# EasyEDA Pro project LinTOS_2026-10-19.epro, schematic Schematic1
Assembly Variant: Basic; Board Name: Board1; Create Date: 2026-08-16; Page Name: P1; Project Name: ESP32-S3-RLCD-BBK; Schematic Name: Schematic1; Update Date: 2026-08-16; Company: 嘉立创EDA; Page Size: A4; Version: V1.0
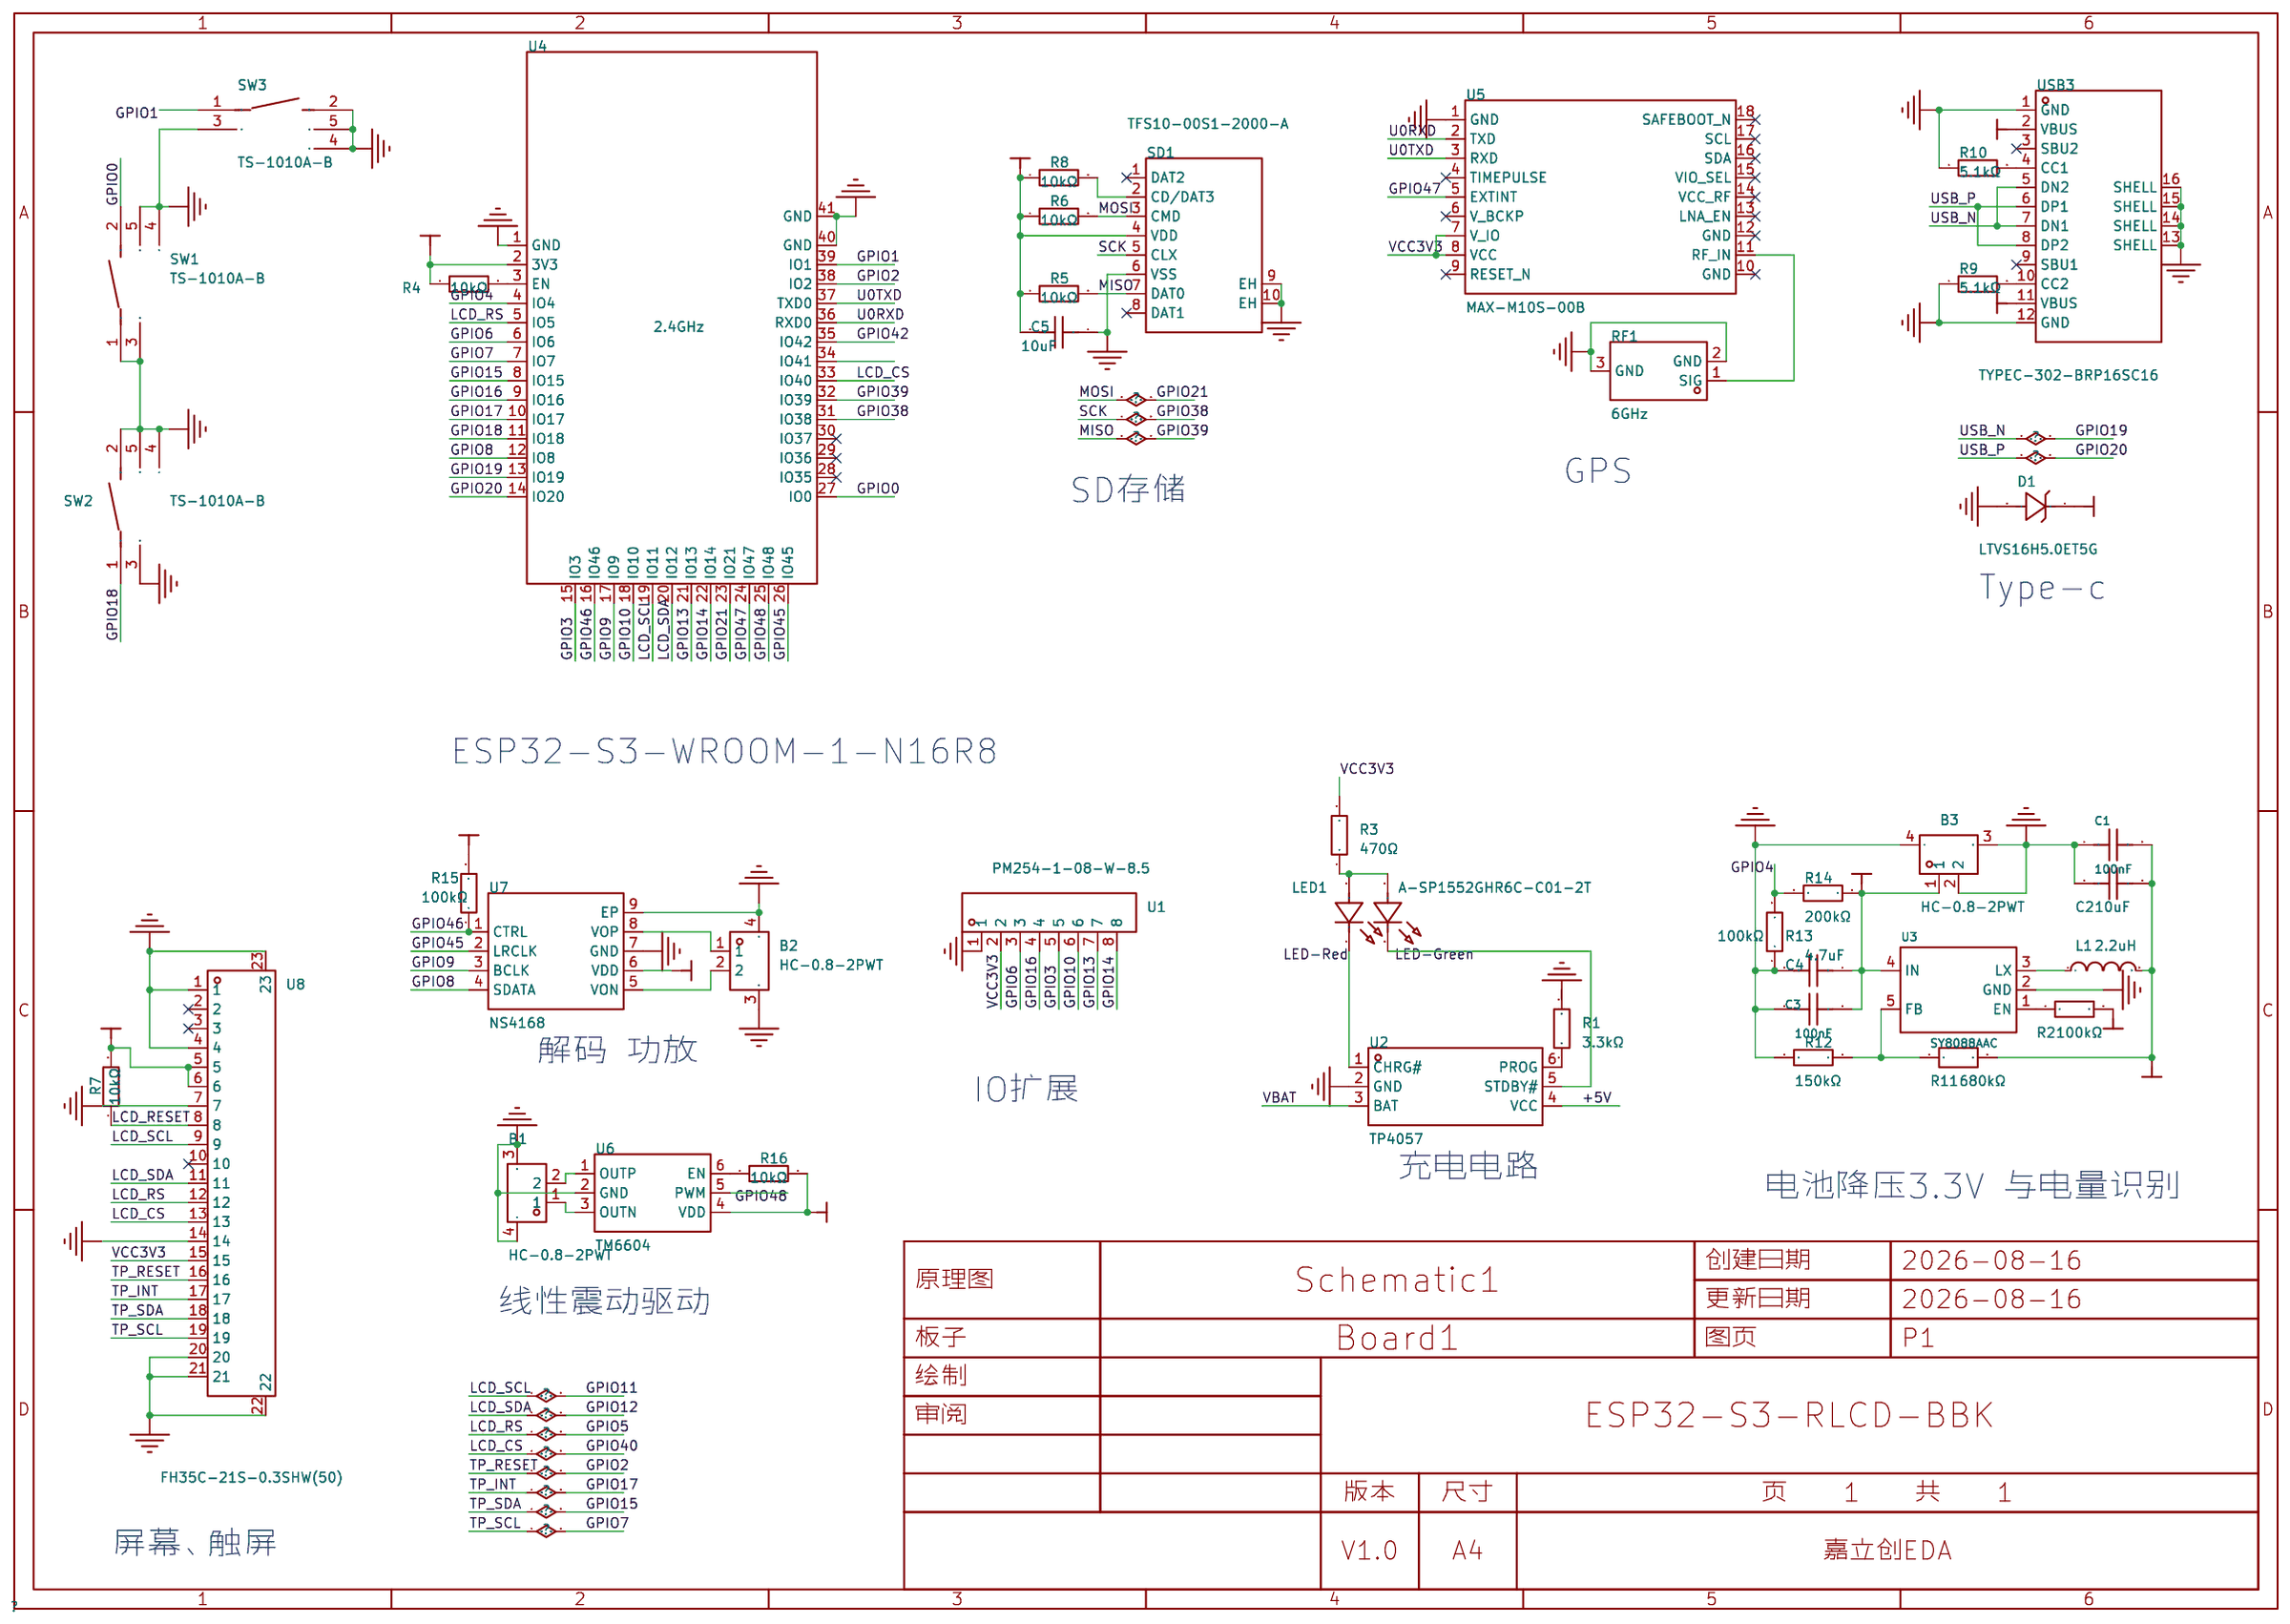
[diagram p0: schematic sheet]

## Parts
B1  HC-0.8-2PWT  [CONN-SMD_2P-P0.80_HCTL_HC-0.8-2PWT]
B2  HC-0.8-2PWT  [CONN-SMD_2P-P0.80_HCTL_HC-0.8-2PWT]
B3  HC-0.8-2PWT  [CONN-SMD_2P-P0.80_HCTL_HC-0.8-2PWT]
C1  100nF  [C0603]
C2  10uF  [C0603]
C3  100nF  [C0603]
C4  4.7uF  [C0603]
C5  10uF  [C0603]
D1  LTVS16H5.0ET5G  [DFN1610-2L_L1.6-W1.0-P1.10-RD]
L1  2.2uH  [IND-SMD_L3.0-W3.0_CDRH2D18-HPNP]
LED1  A-SP1552GHR6C-C01-2T  [LED-SMD_4P-L3.2-W1.6-TR_A-SP1552GHR6C]
R1  3.3kΩ  [R0603]
R2  100kΩ  [R0603]
R3  470Ω  [R0603]
R4  10kΩ  [R0603]
R5  10kΩ  [R0603]
R6  10kΩ  [R0603]
R7  10kΩ  [R0603]
R8  10kΩ  [R0603]
R9  5.1kΩ  [R0603]
R10  5.1kΩ  [R0603]
R11  680kΩ  [R0603]
R12  150kΩ  [R0603]
R13  100kΩ  [R0603]
R14  200kΩ  [R0603]
R15  100kΩ  [R0603]
R16  10kΩ  [R0603]
RF1  6GHz  [IPEX-SMD_BWIPX-1-001E]
SD1  TFS10-00S1-2000-A  [SIM-SMD_TFS10-00S1-2000-A]
SW1  TS-1010A-B  [SW-SMD_TS-1010A-B]
SW2  TS-1010A-B  [SW-SMD_TS-1010A-B]
SW3  TS-1010A-B  [SW-SMD_TS-1010A-B]
U1  PM254-1-08-W-8.5  [HDR-TH_8P-P2.54-H-F-W10.0-N]
U2  TP4057  [SOT-23-6_L2.9-W1.6-P0.95-LS2.8-BR]
U3  SY8088AAC  [SOT-23-5_L3.0-W1.7-P0.95-LS2.8-BR]
U4  2.4GHz  [WIRELM-SMD_ESP32-S3-WROOM-1]
U5  MAX-M10S-00B  [SMD-18_L10.1-W9.7-P1.10-TL_SKG09F]
U6  TM6604  [SOT-23-6_L2.9-W1.6-P0.95-LS2.8-BR]
U7  NS4168  [ESOP-8_L4.9-W3.9-P1.27-LS6.0-BL-EP]
U8  FH35C-21S-0.3SHW(50)  [FPC-SMD_21P-P0.30_FH35C-21S-0.3SHW-50]
USB3  TYPEC-302-BRP16SC16  [USB-C-SMD_TYPEC-302-BRP16SC16]

## Library data of the parts
B1-B3 = HC-0.8-2PWT: 插针结构:1x2P;间距:0.8mm;安装方式:卧贴;参考系列:-;总PIN数:2P;排数:1;每排PIN数:2;行距:-;额定电流:500mA;触头材质:磷青铜;触头镀层:锡;工作温度范围:-25℃~+85℃;; LCSC Part Name: 1x2P 间距:0.8mm 卧贴; Supplier Part: C2845343; Manufacturer: HCTL(华灿天禄); Supplier Footprint: SMD,P=0.8mm,卧贴; JLCPCB Part Class: Extended Part; Datasheet: https://atta.szlcsc.com/upload/public/pdf/source/20230707/4723FD87455A1B942ECF59815D4E1AAF.pdf; Supplier: LCSC; Pins Structure: 1x2P; Pitch: 0.8mm; Mounting Style: 卧贴; Number of Pins: 2P; Number of Rows: 1; Number of PINs Per Row: 2; Current Rating (Max): 500mA; Contact Material: 磷青铜; Contact Plating: 锡; Operating Temperature Range: -25℃~+85℃; Rated Voltage (Max): 30V; Plastic Material: LCP; Flame Retardant Rating: UL94V-0; Supplementary Features: 辅助焊脚; Z-Height of the Board: 1.85mm; X-Length of Bottom Edge on Board (Spacing Line): 3.8mm; Y-Width of Bottom Edge on Board: 2.8mm; Check: true
C1 C3 = CC0603KRX7R9BB104: 容值:100nF;精度:±10%;额定电压:50V;温度系数:X7R;; LCSC Part Name: 100nF ±10% 50V; Supplier Part: C14663; Manufacturer: YAGEO(国巨); Supplier Footprint: 0603; JLCPCB Part Class: Basic Part; Datasheet: https://item.szlcsc.com/datasheet/CC0603KRX7R9BB104/15331.html; Supplier: LCSC; Tolerance: ±10%; Voltage Rating: 50V; Temperature Coefficient: X7R
C2 C5 = CL10A106KP8NNNC: 容值:10uF;精度:±10%;额定电压:10V;温度系数:X5R;; LCSC Part Name: 10uF ±10% 10V; Supplier Part: C19702; Manufacturer: SAMSUNG(三星); Supplier Footprint: 0603; JLCPCB Part Class: Basic Part; Datasheet: https://item.szlcsc.com/datasheet/CL10A106KP8NNNC/20411.html; Supplier: LCSC; Tolerance: ±10%; Voltage Rating: 10V; Temperature Coefficient: X5R
C4 = CL10A475KO8NNNC: 容值:4.7uF;精度:±10%;额定电压:16V;温度系数:X5R;; LCSC Part Name: 4.7uF ±10% 16V; Supplier Part: C19666; Manufacturer: SAMSUNG(三星); Supplier Footprint: 0603; JLCPCB Part Class: Basic Part; Datasheet: https://item.szlcsc.com/datasheet/CL10A475KO8NNNC/20375.html; Supplier: LCSC; Tolerance: ±10%; Voltage Rating: 16V; Temperature Coefficient: X5R; Check: true
D1 = LTVS16H5.0ET5G: 极性:单向;反向截止电压(Vrwm):5V;钳位电压:10.8V;峰值脉冲电流(Ipp):150A@8/20us;峰值脉冲功率(Ppp):1.8kW@8/20us;击穿电压:7.1V;; LCSC Part Name: 单向 5V截止 峰值浪涌电流：150A@8/20us; Supplier Part: C383280; Manufacturer: LRC(乐山无线电); Supplier Footprint: DFN1610-2; JLCPCB Part Class: Extended Part; Datasheet: https://item.szlcsc.com/datasheet/LTVS16H5.0ET5G/356587.html; Supplier: LCSC; Polarity: 单向; Reverse Stand-Off Voltage (Vrwm): 5V; Clamping Voltage: 10.8V; Peak Pulse Current (Ipp): 150A@8/20us; Peak Pulse Power Dissipation (Ppp): 1.8kW@8/20us; Voltage - Breakdown: 7.1V; Reverse Leakage Current (Ir): 600nA; level of protection: IEC 61000-4-2; Junction Capacitance: 800pF; Check: true
L1 = CDRH2D14NP-2R2NC: 电感值:2.2uH;精度:±30%;额定电流:-;饱和电流(Isat):1.5A;; LCSC Part Name: 2.2uH ±30% 1.5A; Supplier Part: C167267; Manufacturer: Sumida(胜美达); Supplier Footprint: SMD,3x3x1.4mm; JLCPCB Part Class: Extended Part; Datasheet: https://atta.szlcsc.com/upload/public/pdf/source/20180125/C167267_15168650612721302968.pdf; Supplier: LCSC; Tolerance: ±30%; Saturation Current (Isat): 1.5A; DC Resistance (DCR): 94mΩ; Check: true
LED1 = A-SP1552GHR6C-C01-2T: 灯头类型:-;发光颜色:绿色,红色;正向压降(Vf):1.6V~2.2V；2.3V~3V;功率:60mW；90mW;正向电流:5mA;波长:520nm~535nm；617.5nm~625.5nm;二极管配置:独立二极管;透镜颜色:无色透明透镜;色温:-;发光强度:180mcd；450mcd;发光角度:120°;载带方式:正贴;工作温度:-40℃~+85℃;; LCSC Part Name: 3227绿红双色正贴; Supplier Part: C19171239; Manufacturer: Amicc(欧密格光电); Supplier Footprint: SMD-4P,3.2x2.7mm; JLCPCB Part Class: Extended Part; Datasheet: https://item.szlcsc.com/datasheet/A-SP1552GHR6C-C01-2T/20382146.html; Supplier: LCSC; Illumination Color: 绿色,红色; Voltage - Forward(Vf): 1.6V~2.2V；2.3V~3V; Power(Watts): 60mW；90mW; Forward Current: 5mA; Wavelength - Dominant: 520nm~535nm；617.5nm~625.5nm; Peak Wavelength: 518nm；632nm; Diode Configuration: 独立二极管; Lens Color: 无色透明透镜; Luminous Intensity: 180mcd；450mcd; Viewing Angle: 120°; Mounting Style: 正贴; Operating Temperature: -40℃~+85℃; Check: true
R1 = 0603WAF3301T5E: 电阻类型:厚膜电阻;阻值:3.3kΩ;精度:±1%;功率:100mW;工作电压:75V;温度系数:±100ppm/℃;; LCSC Part Name: 3.3kΩ ±1% 100mW 厚膜电阻; Supplier Part: C22978; Manufacturer: UNI-ROYAL(厚声); Supplier Footprint: 0603; JLCPCB Part Class: Basic Part; Datasheet: https://item.szlcsc.com/datasheet/0603WAF3301T5E/23705.html; Supplier: LCSC; Type: 厚膜电阻; Tolerance: ±1%; Power(Watts): 100mW; Voltage-Supply(Max): 75V; Temperature Coefficient: ±100ppm/℃; Operating Temperature: -55℃~+155℃
R2 R13 R15 = 0603WAF1003T5E: 电阻类型:厚膜电阻;阻值:100kΩ;精度:±1%;功率:100mW;工作电压:75V;温度系数:±100ppm/℃;; LCSC Part Name: 100kΩ ±1% 100mW 厚膜电阻; Supplier Part: C25803; Manufacturer: UNI-ROYAL(厚声); Supplier Footprint: 0603; JLCPCB Part Class: Basic Part; Datasheet: https://item.szlcsc.com/datasheet/0603WAF1003T5E/26546.html; Supplier: LCSC; Type: 厚膜电阻; Tolerance: ±1%; Power(Watts): 100mW; Voltage-Supply(Max): 75V; Temperature Coefficient: ±100ppm/℃; Operating Temperature: -55℃~+155℃; Check: true
R3 = 0603WAF4700T5E: 电阻类型:厚膜电阻;阻值:470Ω;精度:±1%;功率:100mW;工作电压:75V;温度系数:±100ppm/℃;; LCSC Part Name: 470Ω ±1% 100mW 厚膜电阻; Supplier Part: C23179; Manufacturer: UNI-ROYAL(厚声); Supplier Footprint: 0603; JLCPCB Part Class: Basic Part; Datasheet: https://item.szlcsc.com/datasheet/0603WAF4700T5E/23906.html; Supplier: LCSC; Type: 厚膜电阻; Tolerance: ±1%; Power(Watts): 100mW; Voltage-Supply(Max): 75V; Temperature Coefficient: ±100ppm/℃; Operating Temperature: -55℃~+155℃
R4 = 0603WAF1002T5E: 电阻类型:厚膜电阻;阻值:10kΩ;精度:±1%;功率:100mW;工作电压:75V;温度系数:±100ppm/℃;; LCSC Part Name: 厚膜电阻 10kΩ ±1% 100mW; Supplier Part: C25804; Manufacturer: UNI-ROYAL(厚声); Supplier Footprint: 0603; JLCPCB Part Class: Basic Part; Datasheet: https://item.szlcsc.com/datasheet/0603WAF1002T5E/26547.html; Supplier: LCSC; Type: 厚膜电阻; Tolerance: ±1%; Power(Watts): 100mW; Voltage-Supply(Max): 75V; Temperature Coefficient: ±100ppm/℃; Operating Temperature: -55℃~+155℃; Check: true
R5-R8 R16 = 0603WAF1002T5E: 电阻类型:厚膜电阻;阻值:10kΩ;精度:±1%;功率:100mW;工作电压:75V;温度系数:±100ppm/℃;; LCSC Part Name: 厚膜电阻 10kΩ ±1% 100mW; Supplier Part: C25804; Manufacturer: UNI-ROYAL(厚声); Supplier Footprint: 0603; JLCPCB Part Class: Basic Part; Datasheet: https://item.szlcsc.com/datasheet/0603WAF1002T5E/26547.html; Supplier: LCSC; Type: 厚膜电阻; Tolerance: ±1%; Power(Watts): 100mW; Voltage-Supply(Max): 75V; Temperature Coefficient: ±100ppm/℃; Operating Temperature: -55℃~+155℃
R9 R10 = 0603WAF5101T5E: 电阻类型:厚膜电阻;阻值:5.1kΩ;精度:±1%;功率:100mW;工作电压:75V;温度系数:±100ppm/℃;; LCSC Part Name: 5.1kΩ ±1% 100mW 厚膜电阻; Supplier Part: C23186; Manufacturer: UNI-ROYAL(厚声); Supplier Footprint: 0603; JLCPCB Part Class: Basic Part; Datasheet: https://item.szlcsc.com/datasheet/0603WAF5101T5E/23913.html; Supplier: LCSC; Type: 厚膜电阻; Tolerance: ±1%; Power(Watts): 100mW; Voltage-Supply(Max): 75V; Temperature Coefficient: ±100ppm/℃; Operating Temperature: -55℃~+155℃; Check: true
R11 = FRC0603F6803TS: 电阻类型:厚膜电阻;阻值:680kΩ;精度:±1%;功率:100mW;工作电压:75V;温度系数:±100ppm/℃;; LCSC Part Name: 680kΩ ±1% 100mW 厚膜电阻; Supplier Part: C2907061; Manufacturer: FOJAN(富捷); Supplier Footprint: 0603; JLCPCB Part Class: Extended Part; Supplier: LCSC; Type: 厚膜电阻; Tolerance: ±1%; Power(Watts): 100mW; Voltage-Supply(Max): 75V; Temperature Coefficient: ±100ppm/℃; Operating Temperature: -55℃~+155℃
R12 = 0603WAF1503T5E: 电阻类型:厚膜电阻;阻值:150kΩ;精度:±1%;功率:100mW;工作电压:75V;温度系数:±100ppm/℃;; LCSC Part Name: 150kΩ ±1% 100mW 厚膜电阻; Supplier Part: C22807; Manufacturer: UNI-ROYAL(厚声); Supplier Footprint: 0603; JLCPCB Part Class: Basic Part; Datasheet: https://item.szlcsc.com/datasheet/0603WAF1503T5E/23534.html; Supplier: LCSC; Type: 厚膜电阻; Tolerance: ±1%; Power(Watts): 100mW; Voltage-Supply(Max): 75V; Temperature Coefficient: ±100ppm/℃; Operating Temperature: -55℃~+155℃
R14 = 0603WAF2003T5E: 电阻类型:厚膜电阻;阻值:200kΩ;精度:±1%;功率:100mW;最大工作电压:75V;温度系数:±100ppm/℃;; LCSC Part Name: 200kΩ ±1% 100mW 厚膜电阻; Supplier Part: C25811; Manufacturer: UNI-ROYAL(厚声); Supplier Footprint: 0603; JLCPCB Part Class: Basic Part; Datasheet: https://atta.szlcsc.com/upload/public/pdf/source/20200306/C422600_1E6D84923E4A46A82E41ADD87F860B5C.pdf; Supplier: LCSC; Type: 厚膜电阻; Tolerance: ±1%; Power(Watts): 100mW; Overload Voltage (Max): 75V; Temperature Coefficient: ±100ppm/℃; Operating Temperature Range: -55℃~+155℃; Check: true
RF1 = BWIPX-1-001E: 连接器类型:板端;接口类型:内针;端口数量:1;接口直径:2mm;接口长度/高度:1.25mm;频率:6GHz;射频系列:IPEX;阻抗:50Ω;样式:-;工作温度:-40℃~+85℃;; LCSC Part Name: 内针 IPEX; Supplier Part: C496552; Manufacturer: BAT WIRELESS(蝙蝠无线); Supplier Footprint: SMD; JLCPCB Part Class: Extended Part; Datasheet: https://item.szlcsc.com/datasheet/BWIPX-1-001E/508501.html; Supplier: LCSC; Connector Type: 板端; Interface: 内针; Number of Ports: 1; Interface Diameter: 2mm; Interface Length/Height: 1.25mm; RF Series: IPEX; Impedance: 50Ω; Operating Temperature Range: -40℃~+85℃
SD1 = TFS10-00S1-2000-A: 卡连接方式:拔插式;卡类型:MicroSD卡(TF卡);连接器类型:卡座;本体最大高度:1.9mm;工作温度:-25℃~+90℃;; LCSC Part Name: 拔插式 MicroSD卡(TF卡) 卡座; Supplier Part: C22357902; Manufacturer: XFCN(兴飞); Supplier Footprint: SMD; JLCPCB Part Class: Extended Part; Datasheet: https://item.szlcsc.com/datasheet/TFS10-00S1-2000-A/23793223.html; Supplier: LCSC; Card Connection Mode: 拔插式; Card Type: MicroSD卡(TF卡); Connector Type: 卡座; Additional Card Detection Pins: 无; Height Above Board: 1.9mm; Operating Temperature: -25℃~+90℃
SW1-SW3 = TS-1010A-B: 电路结构:单刀单掷;按钮形状:矩形按钮;作用力:1.6N;安装方式:卧贴;开关长度:4.5mm;开关宽度:3.5mm;开关高度:1.7mm;带支架:不带支架;触点电流:50mA;额定电压:12V;带灯:无;工作寿命:10万次;; LCSC Part Name: 4.5*3.5*1.7mm 卧贴 轻触开关; Supplier Part: C381059; Manufacturer: XKB Connection(中国星坤); Supplier Footprint: SMD,4.5x3.5mm; JLCPCB Part Class: Extended Part; Datasheet: https://item.szlcsc.com/datasheet/TS-1010A-B/353291.html; Supplier: LCSC; Circuit: 单刀单掷; Actuator Style: 矩形按钮; Operating Force: 1.6N; Mounting Type: 卧贴; Length: 4.5mm; Width: 3.5mm; Switch Height: 1.7mm; with Bracket: 不带支架; Contact Current: 50mA; Voltage Rating: 12V; Actuator/Cap Color: 黑色; With Lamp: 无; Life: 10万次; Operating Temperature: -30℃~+85℃
U1 = PM254-1-08-W-8.5: 插孔结构:1x8P;间距:2.54mm;行距:-;圆孔/方孔:方孔;安装方式:弯插;排数:单排;总孔位数:8P;额定电流:3A;额定电压:-;插孔方向:侧面;塑高:8.5mm;触头材质:铜合金;工作温度:-40℃~+105℃;; LCSC Part Name: 1x8P 间距:2.54mm 弯插; Supplier Part: C2897390; Manufacturer: HCTL(华灿天禄); Supplier Footprint: 弯插,P=2.54mm; JLCPCB Part Class: Extended Part; Datasheet: https://item.szlcsc.com/datasheet/PM254-1-08-W-8.5/3142395.html; Supplier: LCSC; Holes Structure: 1x8P; Pitch: 2.54mm; Circular Hole / Square Hole: 方孔; Mounting Type: 弯插; Number of Rows: 单排; Number of Positions: 8P; Current Rating: 3A; Holes Direction: 侧面; Insulation Height: 8.5mm; Contact Material: 铜合金; Operating Temperature: -40℃~+105℃
U2 = TP4057: 工作电压:4V~6.5V;最大充电电流:500mA;电池类型:锂电池;电池节数:1;; LCSC Part Name: 500mA线性锂离子电池充电器; Supplier Part: C725791; Manufacturer: UMW(友台半导体); Supplier Footprint: SOT-23-6; JLCPCB Part Class: Extended Part; Datasheet: https://item.szlcsc.com/datasheet/TP4057/772194.html; Supplier: LCSC; The Chip Type: 充电芯片; Voltage - Supply: 4V~6.5V; Charge Current - Max: 500mA; Charging Saturation Voltage: 4.24V; Type of Battery: 锂电池; Number of Cells: 1; Operating Temperature: -40℃~+85℃; Battery Temperature Detection: 支持; Supply Current (Iq): 25uA; Features: 恒压充电；恒流充电；自动再充电；充电终止；软启动；可编程充电电流；欠压锁定；涓流充电; Check: true
U3 = SY8088AAC: 功能类型:降压型;工作电压:2.5V~5.5V;输出电压:-;输出电流:1A;输出类型:可调;; LCSC Part Name: 降压型 1A 2.5V~5.5V; Supplier Part: C79313; Manufacturer: Silergy(矽力杰); Supplier Footprint: SOT-23-5; JLCPCB Part Class: Extended Part; Datasheet: https://item.szlcsc.com/datasheet/SY8088AAC/80451.html; Supplier: LCSC; Function: 降压型; Voltage - Supply: 2.5V~5.5V; Output Current: 1A; Frequency - Switching: 1.5MHz; Operating Temperature: -40℃~+85℃@(TA)；-40℃~+125℃@(TJ); Synchronous Rectifier: 是; Number of Outputs: 1; Topology: 降压式; Quiescent Current: 40uA; Switch tube (built-in/external): 内置; Output Type: 可调; Features: 轻载高效模式；打嗝限流; Check: true
U4 = ESP32-S3-WROOM-1-N16R8: 核心芯片:ESP32-S3R8;频率:2.4GHz;天线形式:板载PCB天线;发射功率:20.5dBm;接收灵敏度:-103.5dBm;; LCSC Part Name: 不带固件 通用型Wi-Fi+低功耗蓝牙MCU模组; Supplier Part: C2913202; Manufacturer: ESPRESSIF(乐鑫); Supplier Footprint: SMD,25.5x18mm; JLCPCB Part Class: Extended Part; Datasheet: https://item.szlcsc.com/datasheet/ESP32-S3-WROOM-1-N16R8/3198300.html; Supplier: LCSC; Utilized IC / Part: ESP32-S3R8; Interface Type: I2C；GPIO；UART；SPI；USB；I2S; Antenna Type: 板载PCB天线; Output Power: 20.5dBm; Voltage - Supply: 3V~3.6V; Receive  Current: 95mA; Send  Current: 355mA; Sensitivity: -103.5dBm; Operating Temperature: -40℃~+65℃; Check: true
U5 = MAX-M10S-00B: 该模块采用u-blox M10标准精度GNSS平台，为所有L1 GNSS信号提供出色的灵敏度和捕获时间。支持同时接收四个GNSS（GPS、GLONASS、伽利略和北斗）。大量可见卫星使接收器能够选择最佳信号，这最大限度地提高了位置可用性，特别是在诸如深城市峡谷等具有挑战性的条件下。u-blox Super-S（超信号）技术提供了出色的射频灵敏度，并且可以在使用小天线或非视距场景中提高动态定位精度; LCSC Part Name: 标准精度GNSS模块; Supplier Part: C4153167; Manufacturer: U-BLOX(优北罗); Supplier Footprint: LCC-18(9.7x10.1); JLCPCB Part Class: Extended Part; Datasheet: https://item.szlcsc.com/datasheet/MAX-M10S-00B/4722633.html; Supplier: LCSC; Features: 热启动加速；短路检测
U6 = TM6604_C22362584: 灵活触控反馈/Vibra驱动程序1.8V兼容，5V容限数字引脚; LCSC Part Name: 线性振动马达驱动 停产; Supplier Part: C22362584; Manufacturer: TM(天微); Supplier Footprint: SOT-23-6; JLCPCB Part Class: Extended Part; Datasheet: https://item.szlcsc.com/datasheet/TM6604/23808696.html; Supplier: LCSC; Voltage - Supply: 2.7V~5.2V; Quiescent Current(Iq): 1.7mA; Operating Temperature: -40℃~+85℃; Features: 软开关；主动制动功能；电流采样/调节功能
U7 = NS4168_C910588: 功放类型:D类功放;扬声器通道数:单声道;输出功率:2.5Wx1@4Ω;静态电流(Iq):13mA;; LCSC Part Name: 2.5W-I2S数字输入单声道D类音频功率放大器; Supplier Part: C910588; Manufacturer: Nsiway(纳芯威); Supplier Footprint: ESOP-8-EP(3.9x4.9x1.27); JLCPCB Part Class: Extended Part; Datasheet: https://item.szlcsc.com/datasheet/NS4168/978904.html; Supplier: LCSC; Class: D类功放; Speaker Channels: 单声道; Output Power: 2.5Wx1@4Ω; Total Harmonic Distortion + Noise (THD+N): 0.2%; Quiescent Current: 13mA; Signal-to-Noise Ratio: 85dB; Power Supply Rejection Ratio (PSRR): -80dB; Efficiency: 80%; Features: 无滤波器架构；使能/关断功能；自动静音/免噪音开关；内置音频处理；可配置输出拓扑; Voltage - Supply: 3V~5.5V; Check: true
U8 = FH35C-21S-0.3SHW(50): 锁定特性:翻盖式;触点类型:双侧触点/上下接;触点数量:21P;间距:0.3mm;安装方式:卧贴;工作温度:-55℃~+85℃;; LCSC Part Name: 间距:0.3mm P数:21P 翻盖式 双侧触点/上下接; Supplier Part: C5242964; Manufacturer: HRS(广濑); Supplier Footprint: SMD,P=0.3mm,卧贴; JLCPCB Part Class: Extended Part; Datasheet: https://item.szlcsc.com/datasheet/FH35C-21S-0.3SHW(50)/5951809.html; Supplier: LCSC; Locking Feature: 翻盖式; Contact Type: 双侧触点/上下接; Number of Contacts: 21P; Pitch: 0.3mm; Mounting Type: 卧贴; FFC, FCB Thickness: 0.2mm; Height Above Board: 0.88mm; Contact Material: 磷青铜; Contact Plating: 金; Operating Temperature: -55℃~+85℃; Check: true
USB3 = TYPEC-302-BRP16SC16: 连接器类型:Type-C;协议标准:USB 3.1;公母:母;安装方式:沉板;触点数量:16P;端口数量:1;额定电流 - 电源:5A;工作温度:-45℃~+85℃;; LCSC Part Name: Type-C 母 沉板; Supplier Part: C2835313; Manufacturer: XUNPU(讯普); Supplier Footprint: SMD; JLCPCB Part Class: Extended Part; Datasheet: https://item.szlcsc.com/datasheet/TYPEC-302-BRP16SC16/2998971.html; Supplier: LCSC; Connector Type: Type-C; Protocol Standard: USB 3.1; Gender: 母; Mounting Type: 沉板; Number of Contacts: 16P; Number of Ports: 1; Current Rating-Power: 5A; Voltage Rating: 5V; Connect-Disconnect Life: 1万次; Length: 6.5mm; Detection color: 黑色; Operating Temperature: -45℃~+85℃

## Nets
+5V: D1.1(C) U2.4(VCC) USB3.2(VBUS) USB3.11(VBUS)
GND: B1.3 B1.4 B2.3 B2.4 B3.2 B3.3 B3.4 C1.1 C2.1 C3.1 C4.2 C5.1 D1.2(A) R1.2 R9.1 R10.1 R12.1 R13.1 RF1.2(GND) RF1.3(GND) SD1.6(VSS) SD1.9(EH) SD1.10(EH) SW1.1 SW1.3 SW1.4 SW1.5 SW2.2 SW2.3 SW2.4 SW2.5 SW3.2 SW3.3 SW3.4 SW3.5 U1.1 U2.2(GND) U3.2(GND) U4.1(GND) U4.40(GND) U4.41(GND) U5.1(GND) U6.2(GND) U7.7(GND) U7.9(EP) U8.1 U8.4 U8.7 U8.14 U8.20 U8.21 U8.22 U8.23 USB3.1(GND) USB3.12(GND) USB3.13(SHELL) USB3.14(SHELL) USB3.15(SHELL) USB3.16(SHELL)
VBAT: B3.1 C3.2 C4.1 R2.2 R14.1 R16.2 U2.3(BAT) U3.4(IN) U6.4(VDD) U7.6(VDD)
VCC3V3: C1.2 C2.2 C5.2 L1.2 R3.2 R4.1 R5.1 R6.1 R7.2 R8.1 R11.2 R15.2 SD1.4(VDD) U1.2 U4.2(3V3) U5.7(V_IO) U5.8(VCC) U8.5 U8.6 U8.15
GPIO0: SW1.2 U4.27(IO0)
GPIO1: SW3.1 U4.39(IO1)
GPIO2: U4.38(IO2) U8.16
GPIO3: U1.5 U4.15(IO3)
GPIO4: R13.2 R14.2 U4.4(IO4)
GPIO5: U4.5(IO5) U8.12
GPIO6: U1.3 U4.6(IO6)
GPIO7: U4.7(IO7) U8.19
GPIO8: U4.12(IO8) U7.4(SDATA)
GPIO9: U4.17(IO9) U7.3(BCLK)
GPIO10: U1.6 U4.18(IO10)
GPIO11: U4.19(IO11) U8.9
GPIO12: U4.20(IO12) U8.11
GPIO13: U1.7 U4.21(IO13)
GPIO14: U1.8 U4.22(IO14)
GPIO15: U4.8(IO15) U8.18
GPIO16: U1.4 U4.9(IO16)
GPIO17: U4.10(IO17) U8.17
GPIO18: SW2.1 U4.11(IO18)
GPIO19: U4.13(IO19) USB3.5(DN2) USB3.7(DN1)
GPIO20: U4.14(IO20) USB3.6(DP1) USB3.8(DP2)
GPIO21: R6.2 SD1.3(CMD) U4.23(IO21)
GPIO38: SD1.5(CLX) U4.31(IO38)
GPIO39: R5.2 SD1.7(DAT0) U4.32(IO39)
GPIO40: U4.33(IO40) U8.13
GPIO42: U4.35(IO42)
GPIO45: U4.26(IO45) U7.2(LRCLK)
GPIO46: R15.1 U4.16(IO46) U7.1(CTRL)
GPIO47: U4.24(IO47) U5.5(EXTINT)
GPIO48: U4.25(IO48) U6.5(PWM)
LCD_RESET: R7.1 U8.8
LED-Green: LED1.3(-) U2.5(STDBY#)
LED-Red: LED1.4(-) U2.1(CHRG#)
U0RXD: U4.36(RXD0) U5.2(TXD)
U0TXD: U4.37(TXD0) U5.3(RXD)
$1N168: L1.1 U3.3(LX)
$1N178: R11.1 R12.2 U3.5(FB)
$1N207: LED1.1(+) LED1.2(+) R3.1
$1N209: R1.1 U2.6(PROG)
$1N229: B1.1 U6.3(OUTN)
$1N248: R2.1 U3.1(EN)
$1N390: R10.2 USB3.4(CC1)
$1N401: RF1.1(SIG) U5.11(RF_IN)
$1N406: B2.1 U7.8(VOP)
$1N407: B2.2 U7.5(VON)
$1N442: R4.2 U4.3(EN)
$1N487: B1.2 U6.1(OUTP)
$1N559: R9.2 USB3.10(CC2)
$1N575: R8.2 SD1.2(CD/DAT3)
$1N576: R16.1 U6.6(EN)

Not connected (* = marked no-connect by the designer): SD1 1(DAT2)* 8(DAT1)*; U4 28(IO35)* 29(IO36)* 30(IO37)* 34(IO41); U5 4(TIMEPULSE)* 6(V_BCKP)* 9(RESET_N)* 10(GND)* 12(GND)* 13(LNA_EN)* 14(VCC_RF)* 15(VIO_SEL)* 16(SDA)* 17(SCL)* 18(SAFEBOOT_N)*; U8 2* 3* 10*; USB3 3(SBU2)* 9(SBU1)*

## Notes on the sheet
- GPS
- SD存储
- Type-c
- ESP32-S3-WROOM-1-N16R8
- 解码 功放
- IO扩展
- 充电电路
- 电池降压3.3V 与电量识别
- 线性震动驱动
- 屏幕、触屏
